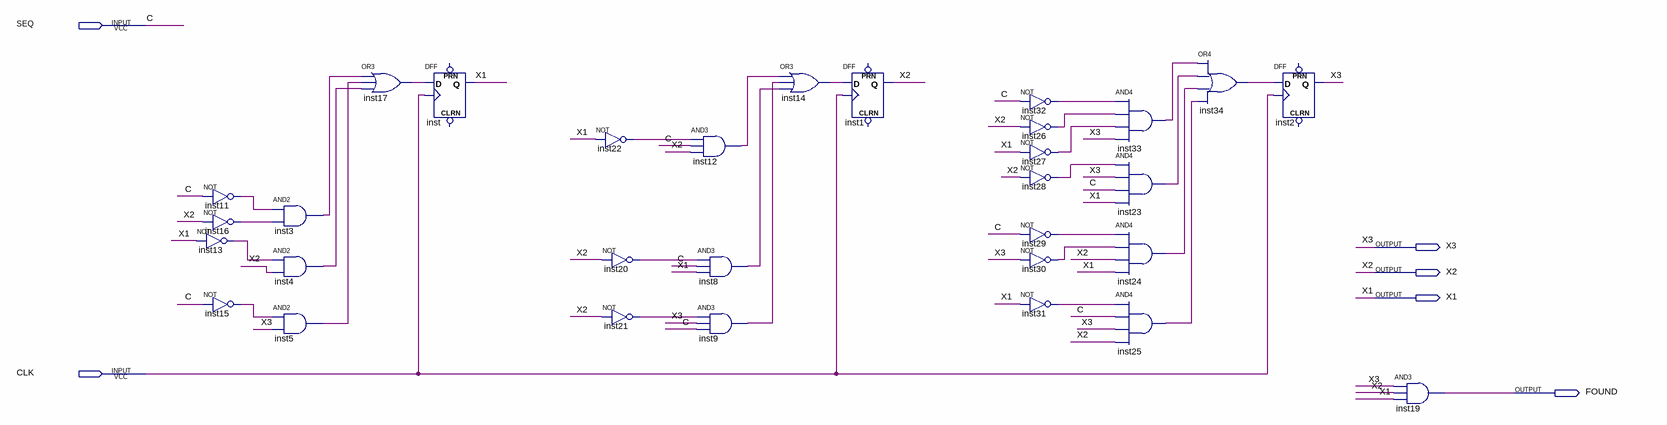
[diagram p0: schematic sheet]
// Quartus schematic Detector_Sequencia.bdf as structural Verilog: 31 symbols, 6 pins
module Detector_Sequencia (
  input  SEQ,
  input  CLK,
  output X3,
  output X2,
  output X1,
  output FOUND
);

  wire inst3_out, inst4_out, inst5_out, inst8_out, inst9_out, inst11_out, inst12_out, inst13_out, inst14_out,
       inst15_out, inst16_out, inst17_out, inst20_out, inst21_out, inst22_out, inst23_out, inst24_out,
       inst25_out, inst26_out, inst27_out, inst28_out, inst29_out, inst30_out, inst31_out, inst32_out,
       inst33_out, inst34_out;

  not inst11 (inst11_out, SEQ);
  not inst16 (inst16_out, X2);
  not inst13 (inst13_out, X1);
  not inst15 (inst15_out, SEQ);
  and inst3 (inst3_out, inst11_out, inst16_out);
  and inst4 (inst4_out, inst13_out, X2);
  and inst5 (inst5_out, inst15_out, X3);
  or inst17 (inst17_out, inst3_out, inst5_out, inst4_out);
  DFF inst (.CLK(CLK), .D(inst17_out), .Q(X1));  // open: CLRN, PRN
  not inst22 (inst22_out, X1);
  not inst20 (inst20_out, X2);
  not inst21 (inst21_out, X2);
  and inst12 (inst12_out, inst22_out, SEQ, X2);
  and inst8 (inst8_out, inst20_out, SEQ, X1);
  and inst9 (inst9_out, inst21_out, X3, SEQ);
  or inst14 (inst14_out, inst12_out, inst9_out, inst8_out);
  DFF inst1 (.CLK(CLK), .D(inst14_out), .Q(X2));  // open: CLRN, PRN
  not inst32 (inst32_out, SEQ);
  not inst26 (inst26_out, X2);
  not inst27 (inst27_out, X1);
  not inst28 (inst28_out, X2);
  not inst29 (inst29_out, SEQ);
  not inst30 (inst30_out, X3);
  not inst31 (inst31_out, X1);
  and inst33 (inst33_out, inst32_out, inst26_out, inst27_out, X3);
  and inst23 (inst23_out, inst28_out, X3, SEQ, X1);
  and inst24 (inst24_out, inst29_out, inst30_out, X2, X1);
  and inst25 (inst25_out, inst31_out, SEQ, X3, X2);
  or inst34 (inst34_out, inst33_out, inst23_out, inst24_out, inst25_out);
  DFF inst2 (.CLK(CLK), .D(inst34_out), .Q(X3));  // open: CLRN, PRN
  and inst19 (FOUND, X3, X2, X1);

  // Other names for the same wires on the sheet: C = SEQ
endmodule
